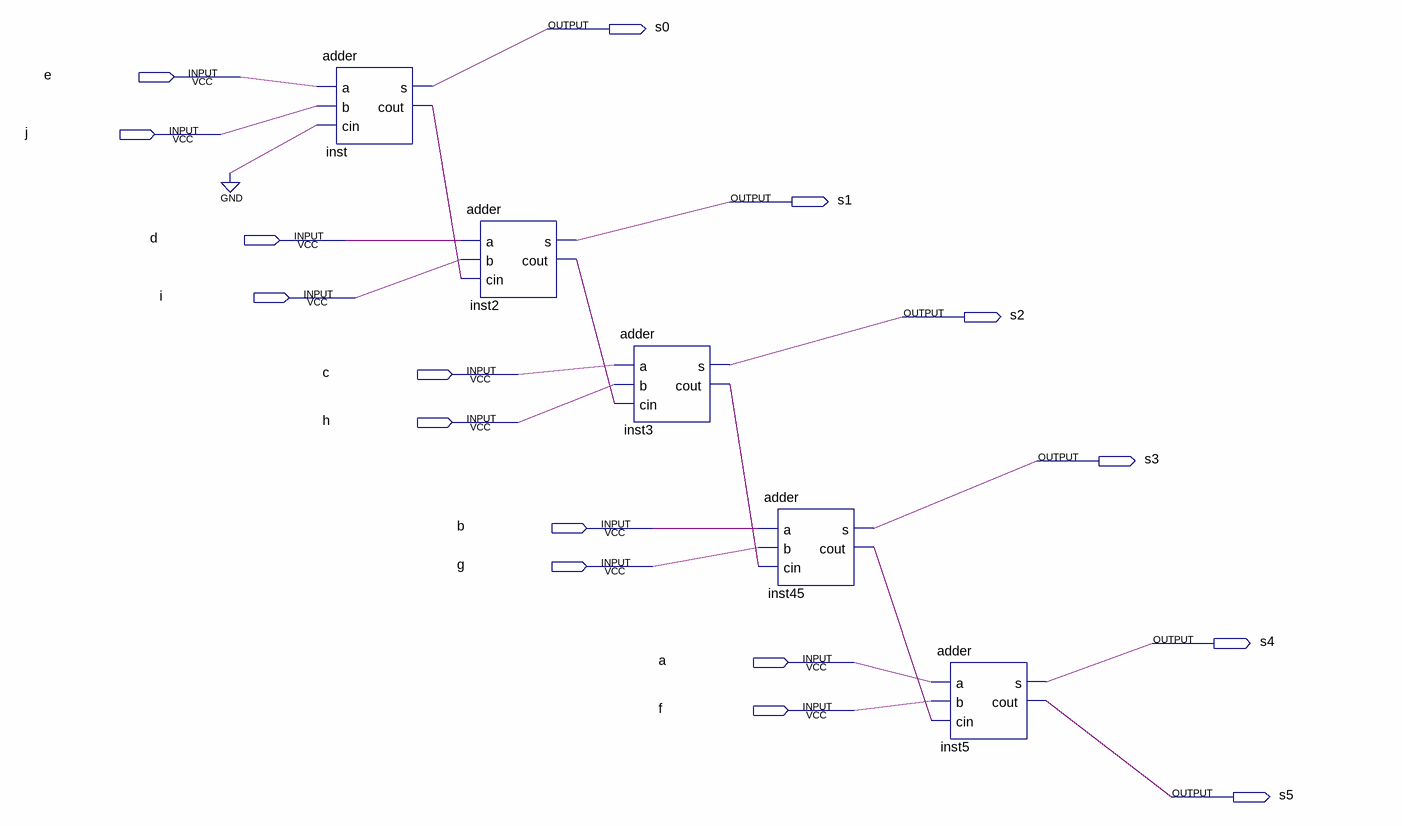
[diagram p0: schematic sheet]
// Quartus schematic adder5bits.bdf as structural Verilog: 5 symbols, 16 pins
module adder5bits (
  input  e,
  input  j,
  input  d,
  input  i,
  input  c,
  input  h,
  input  b,
  input  g,
  input  a,
  input  f,
  output s0,
  output s1,
  output s2,
  output s3,
  output s4,
  output s5
);

  wire inst2_cout, inst3_cout, inst45_cout, inst_cout;

  adder inst (.a(e), .b(j), .cin(1'b0), .s(s0), .cout(inst_cout));
  adder inst2 (.a(d), .b(i), .cin(inst_cout), .s(s1), .cout(inst2_cout));
  adder inst3 (.a(c), .b(h), .cin(inst2_cout), .s(s2), .cout(inst3_cout));
  adder inst45 (.a(b), .b(g), .cin(inst3_cout), .s(s3), .cout(inst45_cout));
  adder inst5 (.a(a), .b(f), .cin(inst45_cout), .s(s4), .cout(s5));
endmodule
